# Altium project QSTL_QD4_2SET_38PAD.PrjPcb
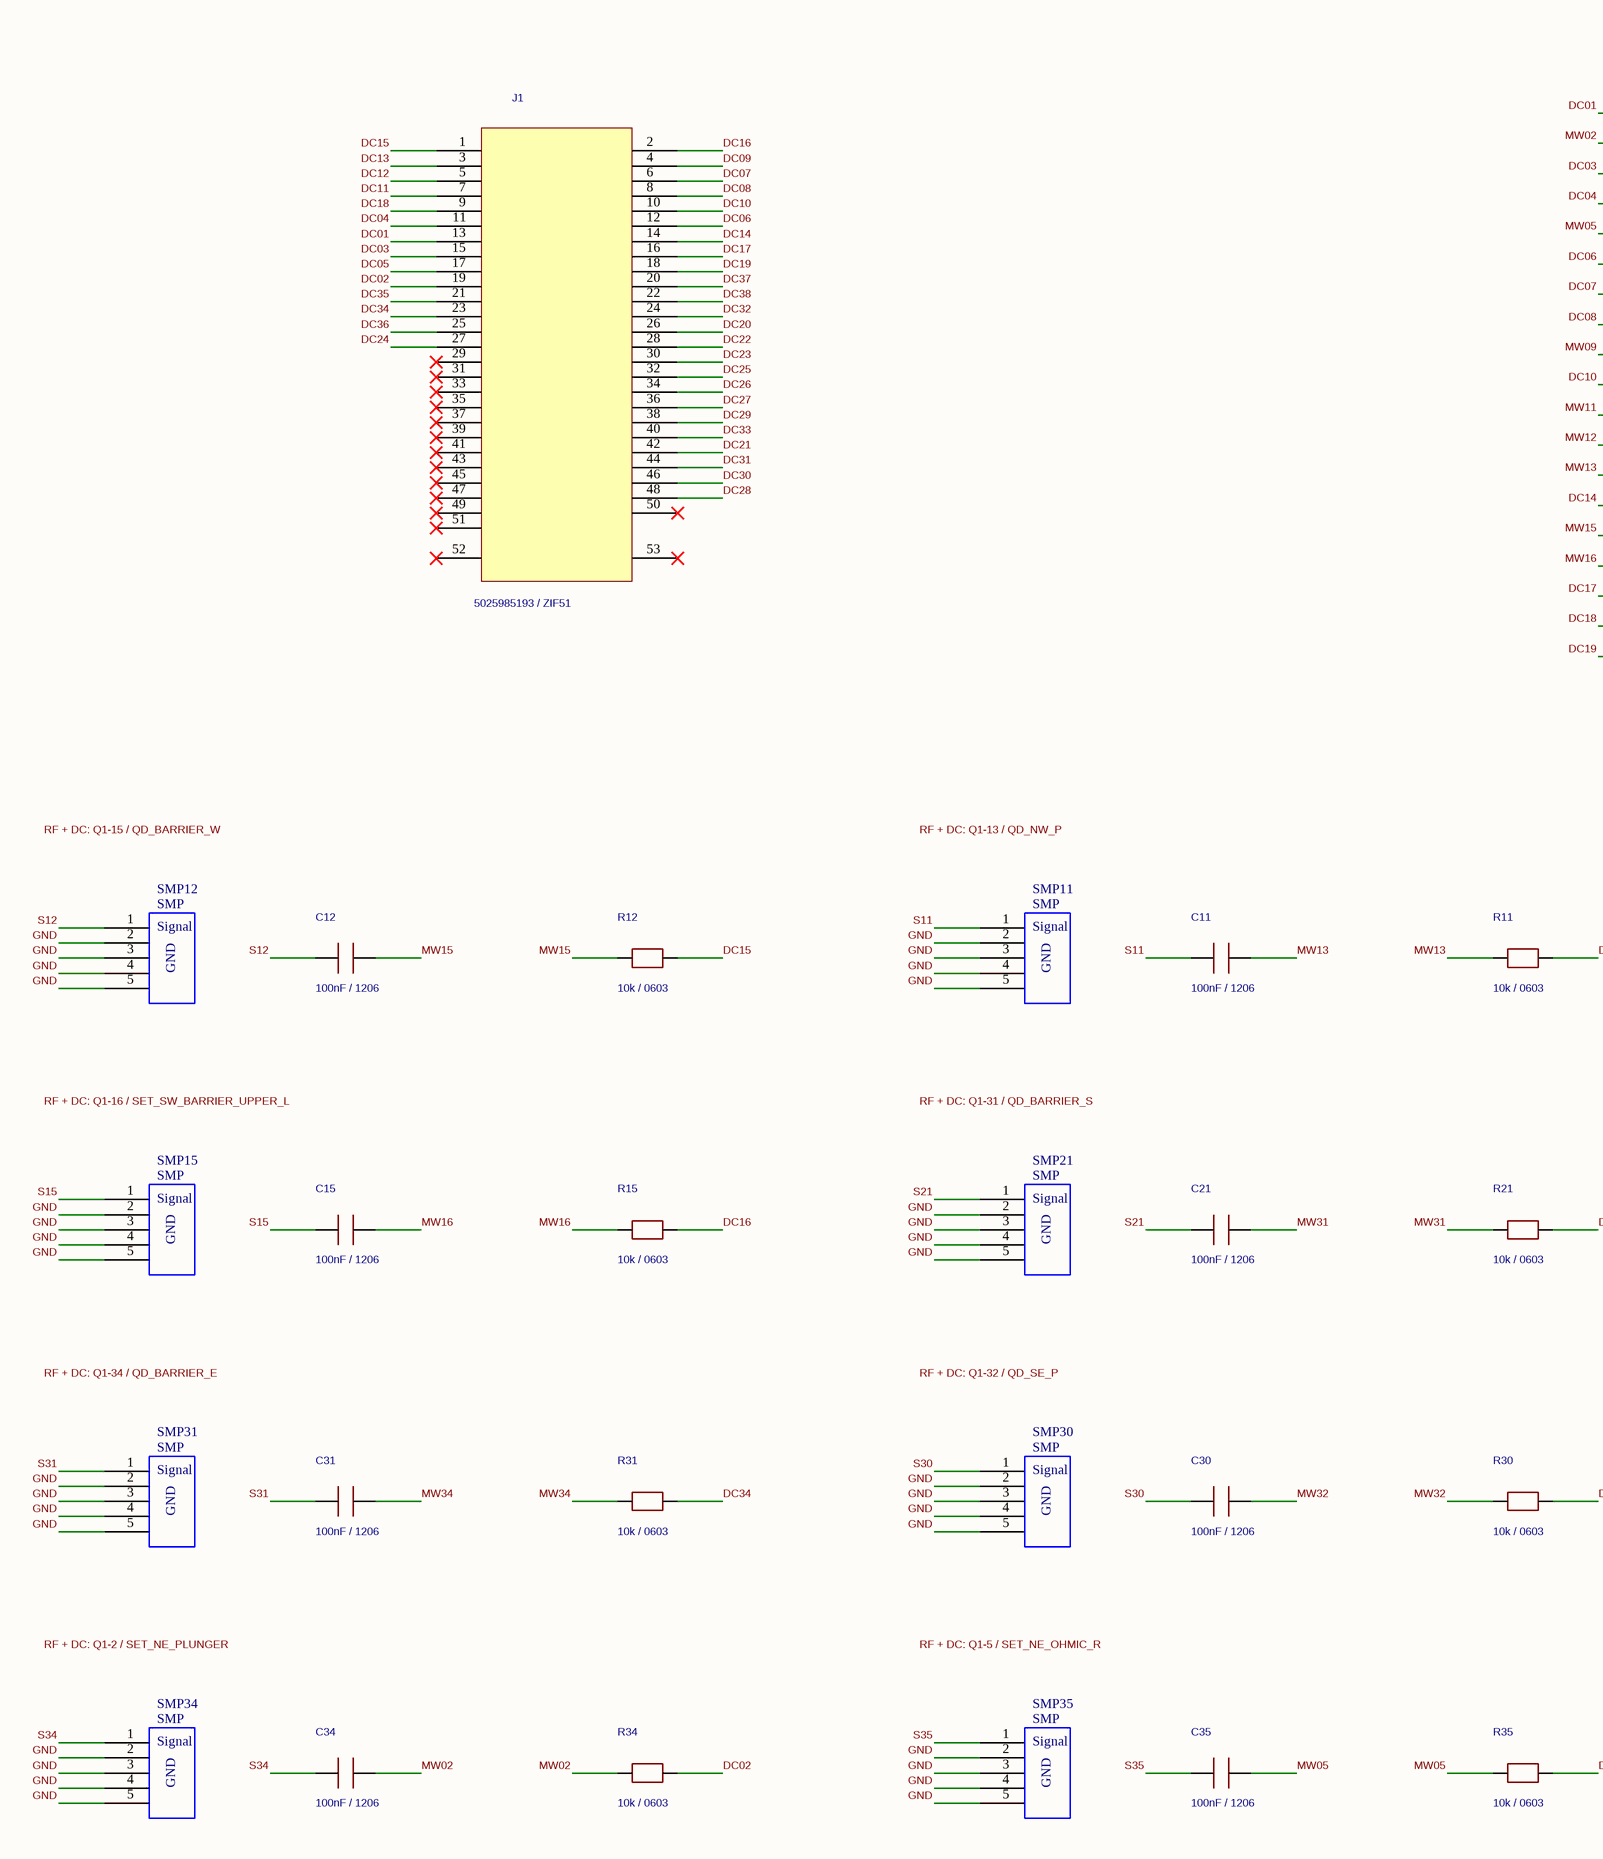
[diagram p0: QSTL_QD4_2SET_38PAD.SchDoc, left]
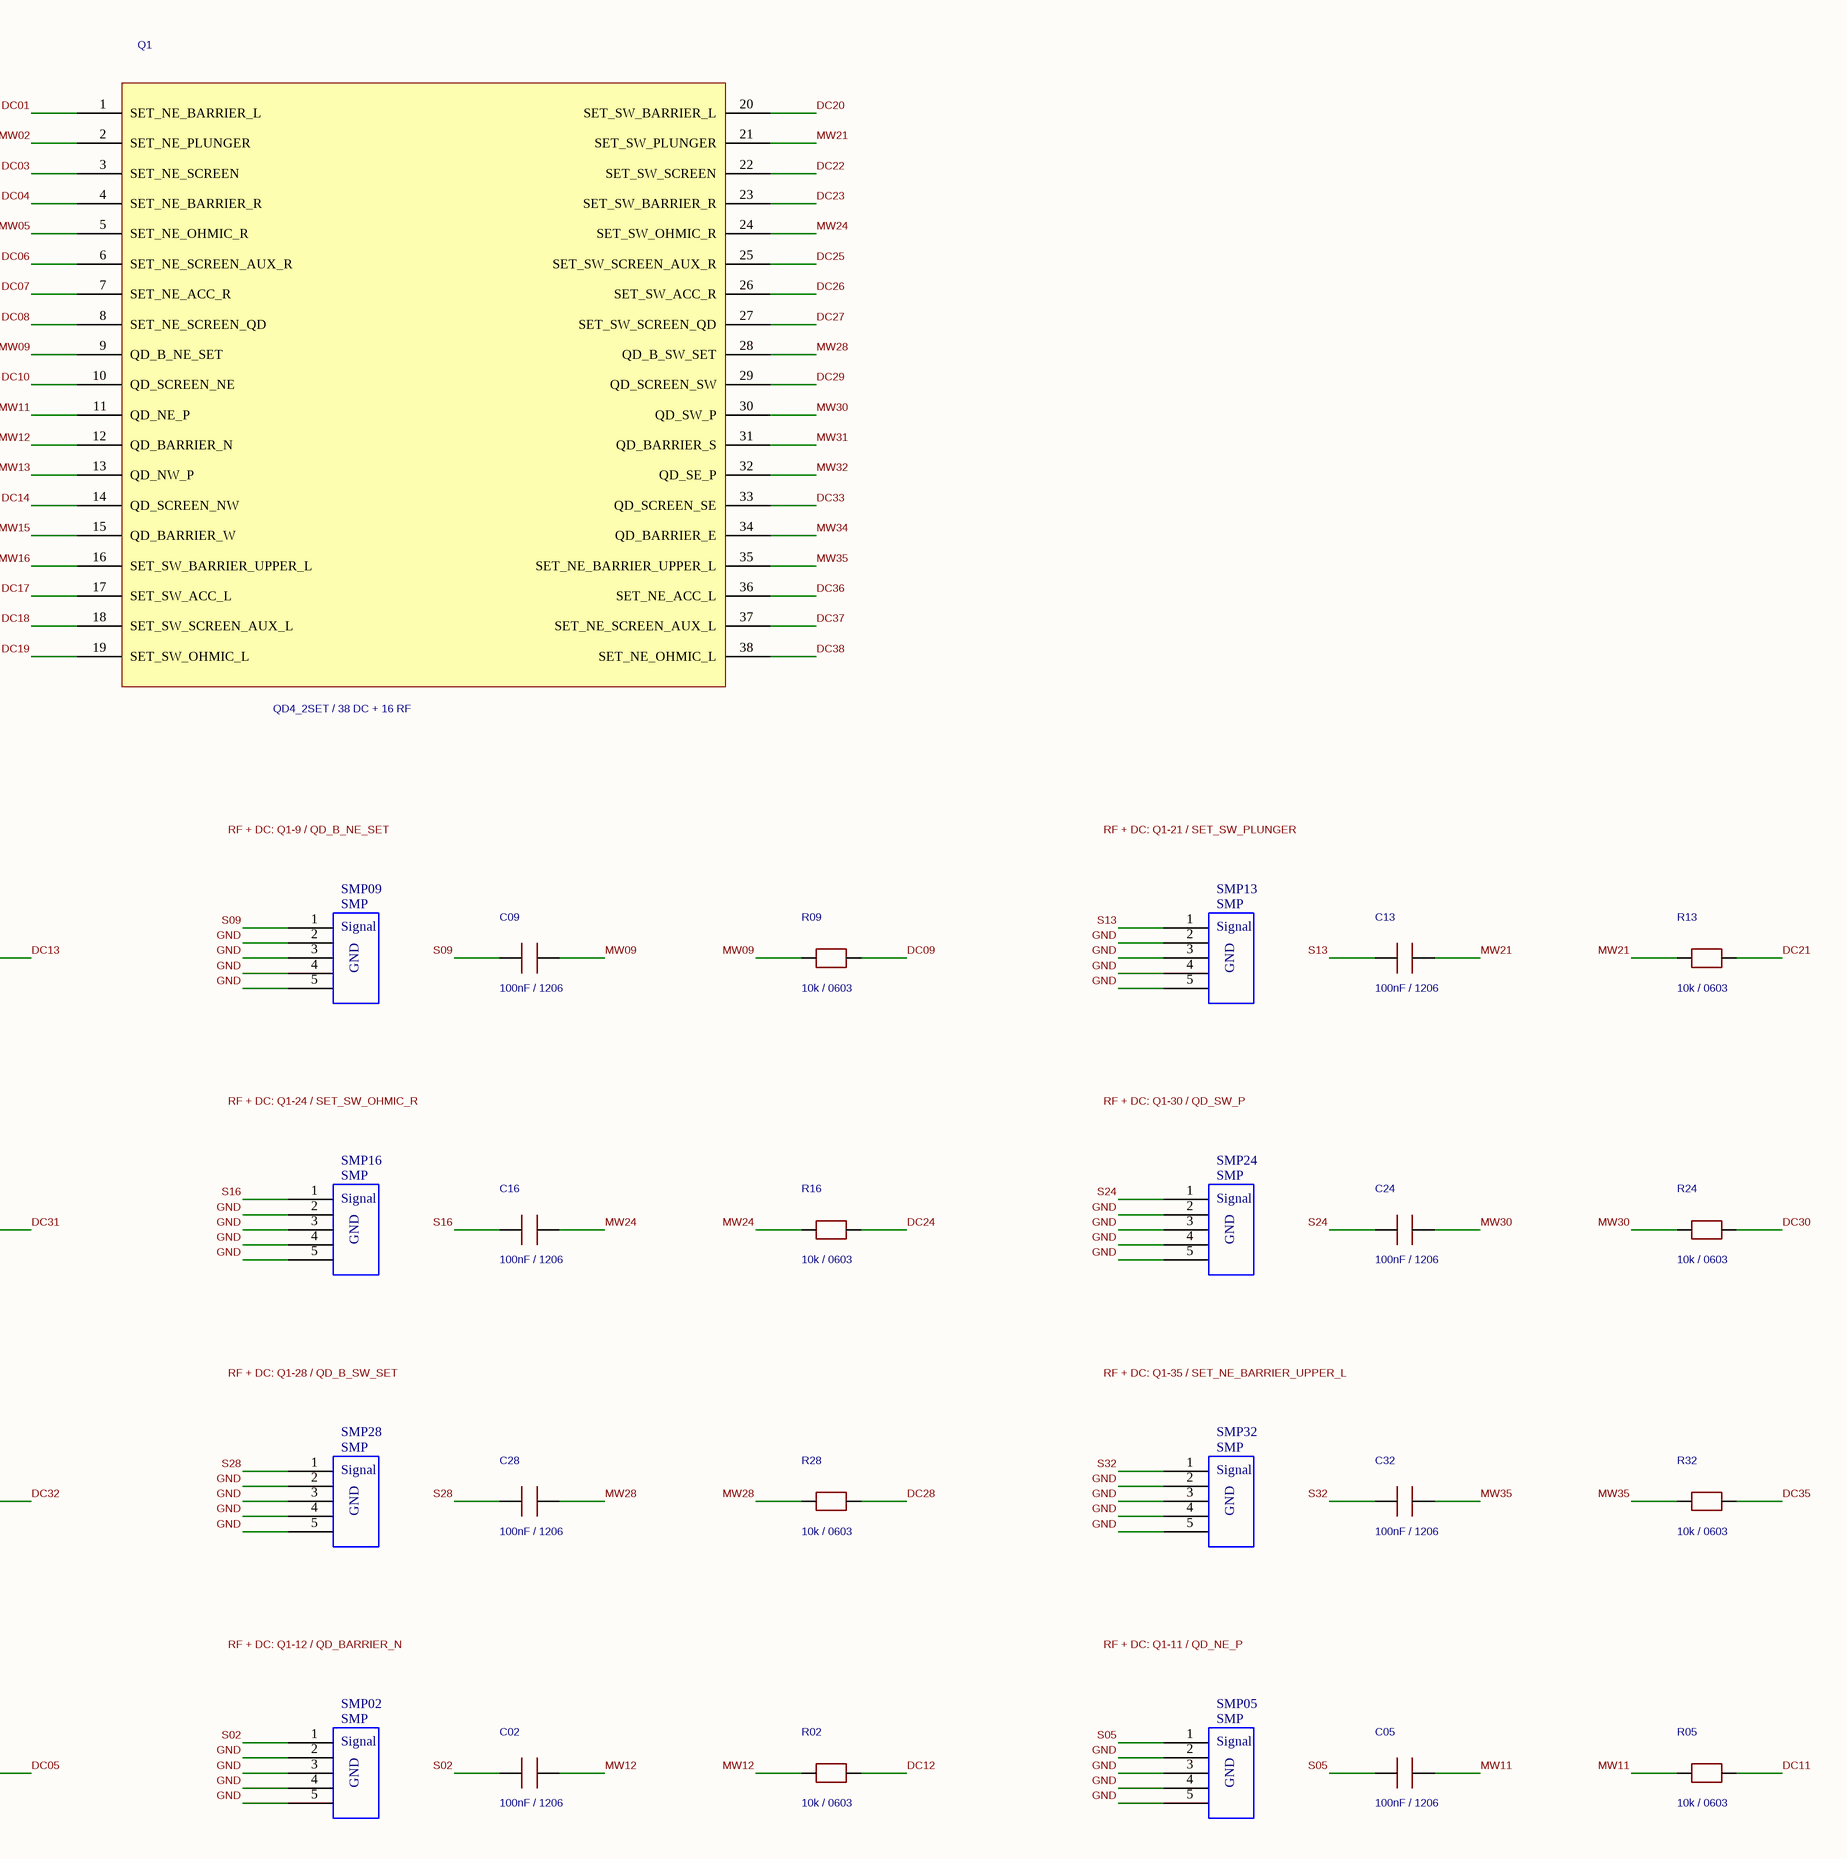
[diagram p1: QSTL_QD4_2SET_38PAD.SchDoc, right]
1 sheet, 50 parts. Net scope: global (net labels, ports and power ports of the same name join across sheets).
Board file: QSTL_QD4_2SET_38PAD.PcbDoc

## Sheet QSTL_QD4_2SET_38PAD.SchDoc: QD4_2SET carrier: 38 DC / 16 RF bias tees
size 609 x 406 mm; SheetNumber: 1; SheetTotal: 1

### Parts
C02  100nF / 1206  [CAPC3216_CC1206JKNPO9BN104]
C05  100nF / 1206  [CAPC3216_CC1206JKNPO9BN104]
C09  100nF / 1206  [CAPC3216_CC1206JKNPO9BN104]
C11  100nF / 1206  [CAPC3216_CC1206JKNPO9BN104]
C12  100nF / 1206  [CAPC3216_CC1206JKNPO9BN104]
C13  100nF / 1206  [CAPC3216_CC1206JKNPO9BN104]
C15  100nF / 1206  [CAPC3216_CC1206JKNPO9BN104]
C16  100nF / 1206  [CAPC3216_CC1206JKNPO9BN104]
C21  100nF / 1206  [CAPC3216_CC1206JKNPO9BN104]
C24  100nF / 1206  [CAPC3216_CC1206JKNPO9BN104]
C28  100nF / 1206  [CAPC3216_CC1206JKNPO9BN104]
C30  100nF / 1206  [CAPC3216_CC1206JKNPO9BN104]
C31  100nF / 1206  [CAPC3216_CC1206JKNPO9BN104]
C32  100nF / 1206  [CAPC3216_CC1206JKNPO9BN104]
C34  100nF / 1206  [CAPC3216_CC1206JKNPO9BN104]
C35  100nF / 1206  [CAPC3216_CC1206JKNPO9BN104]
J1  5025985193 / ZIF51  [FP-5025985193-MFG]
Q1  QD4_2SET / 38 DC + 16 RF  [QD4_2SET_38]
R02  10k / 0603  [CC1608-0603]
R05  10k / 0603  [CC1608-0603]
R09  10k / 0603  [CC1608-0603]
R11  10k / 0603  [CC1608-0603]
R12  10k / 0603  [CC1608-0603]
R13  10k / 0603  [CC1608-0603]
R15  10k / 0603  [CC1608-0603]
R16  10k / 0603  [CC1608-0603]
R21  10k / 0603  [CC1608-0603]
R24  10k / 0603  [CC1608-0603]
R28  10k / 0603  [CC1608-0603]
R30  10k / 0603  [CC1608-0603]
R31  10k / 0603  [CC1608-0603]
R32  10k / 0603  [CC1608-0603]
R34  10k / 0603  [CC1608-0603]
R35  10k / 0603  [CC1608-0603]
SMP02  SMP  [RF_Con]
SMP05  SMP  [RF_Con]
SMP09  SMP  [RF_Con]
SMP11  SMP  [RF_Con]
SMP12  SMP  [RF_Con]
SMP13  SMP  [RF_Con]
SMP15  SMP  [RF_Con]
SMP16  SMP  [RF_Con]
SMP21  SMP  [RF_Con]
SMP24  SMP  [RF_Con]
SMP28  SMP  [RF_Con]
SMP30  SMP  [RF_Con]
SMP31  SMP  [RF_Con]
SMP32  SMP  [RF_Con]
SMP34  SMP  [RF_Con]
SMP35  SMP  [RF_Con]

### Nets
DC01: J1.13 Q1.1(SET_NE_BARRIER_L)
DC02: J1.19 R34.2
DC03: J1.15 Q1.3(SET_NE_SCREEN)
DC04: J1.11 Q1.4(SET_NE_BARRIER_R)
DC05: J1.17 R35.2
DC06: J1.12 Q1.6(SET_NE_SCREEN_AUX_R)
DC07: J1.6 Q1.7(SET_NE_ACC_R)
DC08: J1.8 Q1.8(SET_NE_SCREEN_QD)
DC09: J1.4 R09.2
DC10: J1.10 Q1.10(QD_SCREEN_NE)
DC11: J1.7 R05.2
DC12: J1.5 R02.2
DC13: J1.3 R11.2
DC14: J1.14 Q1.14(QD_SCREEN_NW)
DC15: J1.1 R12.2
DC16: J1.2 R15.2
DC17: J1.16 Q1.17(SET_SW_ACC_L)
DC18: J1.9 Q1.18(SET_SW_SCREEN_AUX_L)
DC19: J1.18 Q1.19(SET_SW_OHMIC_L)
DC20: J1.26 Q1.20(SET_SW_BARRIER_L)
DC21: J1.42 R13.2
DC22: J1.28 Q1.22(SET_SW_SCREEN)
DC23: J1.30 Q1.23(SET_SW_BARRIER_R)
DC24: J1.27 R16.2
DC25: J1.32 Q1.25(SET_SW_SCREEN_AUX_R)
DC26: J1.34 Q1.26(SET_SW_ACC_R)
DC27: J1.36 Q1.27(SET_SW_SCREEN_QD)
DC28: J1.48 R28.2
DC29: J1.38 Q1.29(QD_SCREEN_SW)
DC30: J1.46 R24.2
DC31: J1.44 R21.2
DC32: J1.24 R30.2
DC33: J1.40 Q1.33(QD_SCREEN_SE)
DC34: J1.23 R31.2
DC35: J1.21 R32.2
DC36: J1.25 Q1.36(SET_NE_ACC_L)
DC37: J1.20 Q1.37(SET_NE_SCREEN_AUX_L)
DC38: J1.22 Q1.38(SET_NE_OHMIC_L)
GND: SMP02.2 SMP02.3 SMP02.4 SMP02.5 SMP05.2 SMP05.3 SMP05.4 SMP05.5 SMP09.2 SMP09.3 SMP09.4 SMP09.5 SMP11.2 SMP11.3 SMP11.4 SMP11.5 SMP12.2 SMP12.3 SMP12.4 SMP12.5 SMP13.2 SMP13.3 SMP13.4 SMP13.5 SMP15.2 SMP15.3 SMP15.4 SMP15.5 SMP16.2 SMP16.3 SMP16.4 SMP16.5 SMP21.2 SMP21.3 SMP21.4 SMP21.5 SMP24.2 SMP24.3 SMP24.4 SMP24.5 SMP28.2 SMP28.3 SMP28.4 SMP28.5 SMP30.2 SMP30.3 SMP30.4 SMP30.5 SMP31.2 SMP31.3 SMP31.4 SMP31.5 SMP32.2 SMP32.3 SMP32.4 SMP32.5 SMP34.2 SMP34.3 SMP34.4 SMP34.5 SMP35.2 SMP35.3 SMP35.4 SMP35.5
MW02: C34.2 Q1.2(SET_NE_PLUNGER) R34.1
MW05: C35.2 Q1.5(SET_NE_OHMIC_R) R35.1
MW09: C09.2 Q1.9(QD_B_NE_SET) R09.1
MW11: C05.2 Q1.11(QD_NE_P) R05.1
MW12: C02.2 Q1.12(QD_BARRIER_N) R02.1
MW13: C11.2 Q1.13(QD_NW_P) R11.1
MW15: C12.2 Q1.15(QD_BARRIER_W) R12.1
MW16: C15.2 Q1.16(SET_SW_BARRIER_UPPER_L) R15.1
MW21: C13.2 Q1.21(SET_SW_PLUNGER) R13.1
MW24: C16.2 Q1.24(SET_SW_OHMIC_R) R16.1
MW28: C28.2 Q1.28(QD_B_SW_SET) R28.1
MW30: C24.2 Q1.30(QD_SW_P) R24.1
MW31: C21.2 Q1.31(QD_BARRIER_S) R21.1
MW32: C30.2 Q1.32(QD_SE_P) R30.1
MW34: C31.2 Q1.34(QD_BARRIER_E) R31.1
MW35: C32.2 Q1.35(SET_NE_BARRIER_UPPER_L) R32.1
S02: C02.1 SMP02.1
S05: C05.1 SMP05.1
S09: C09.1 SMP09.1
S11: C11.1 SMP11.1
S12: C12.1 SMP12.1
S13: C13.1 SMP13.1
S15: C15.1 SMP15.1
S16: C16.1 SMP16.1
S21: C21.1 SMP21.1
S24: C24.1 SMP24.1
S28: C28.1 SMP28.1
S30: C30.1 SMP30.1
S31: C31.1 SMP31.1
S32: C32.1 SMP32.1
S34: C34.1 SMP34.1
S35: C35.1 SMP35.1

Not connected (* = marked no-connect by the designer): J1 29* 31* 33* 35* 37* 39* 41* 43* 45* 47* 49* 50* 51* 52(MNT_1)* 53(MNT_2)*

### Notes on the sheet
- RF + DC: Q1-15 / QD_BARRIER_W
- RF + DC: Q1-13 / QD_NW_P
- RF + DC: Q1-9 / QD_B_NE_SET
- RF + DC: Q1-21 / SET_SW_PLUNGER
- RF + DC: Q1-16 / SET_SW_BARRIER_UPPER_L
- RF + DC: Q1-31 / QD_BARRIER_S
- RF + DC: Q1-24 / SET_SW_OHMIC_R
- RF + DC: Q1-30 / QD_SW_P
- RF + DC: Q1-34 / QD_BARRIER_E
- RF + DC: Q1-32 / QD_SE_P
- RF + DC: Q1-28 / QD_B_SW_SET
- RF + DC: Q1-35 / SET_NE_BARRIER_UPPER_L
- RF + DC: Q1-2 / SET_NE_PLUNGER
- RF + DC: Q1-5 / SET_NE_OHMIC_R
- RF + DC: Q1-12 / QD_BARRIER_N
- RF + DC: Q1-11 / QD_NE_P
- (in symbol SMP) Signal; GND

### Library data of the parts
C02 C05 C09 C11-C13 C15 C16 C21 C24 C28 C30-C32 C34 C35 = CC1206JKNPO9BN104: Yageo CC1206JKNPO9BN104; 100nF 50V 5% C0G (NP0); 1206; Layout status: RF6/DC18; QD/R/C Bottom; inline RF resistor pad; via in pad; Value: 100nF; Case/Package: 1206; Manufacturer: Yageo; Manufacturer Part Number: CC1206JKNPO9BN104; Voltage: 50V; Tolerance: 5%; Dielectric: C0G (NP0); Height (max): 1.8mm
J1 = ZIF_5025985193_53: Molex5025985193;51signals+2mountpads; single-part local symbol derived from actual native two-part source; Manufacturer: Molex; Manufacturer Part Number: 5025985193
Q1 = QD4_2SET_38: QD4_2SET: 38 independent DC terminals; 16 RF terminals through bias tees
R02 R05 R09 R11-R13 R15 R16 R21 R24 R28 R30-R32 R34 R35 = R_0603_10k: Generic 0603 resistor 10k; value from saved reference schematic; Layout status: RF6/DC18; QD/R/C Bottom; inline RF resistor pad; via in pad; Value: 10k; Case/Package: 0603 (1608 metric)